# Altium schematic sheet 09_AUDIO.SchDoc
size 287 x 157 mm; DsnPath: C:\Users\nilot\Documents\VSCode\SBC\imports\SG2002_QFN88_38_20230301_4L_V1.3_16.2.DSN; SchematicName: CV181xC_QFN88_38_DemoBoard; PageName: 09_AUDIO; PageSize: Custom; TopSchematic: True
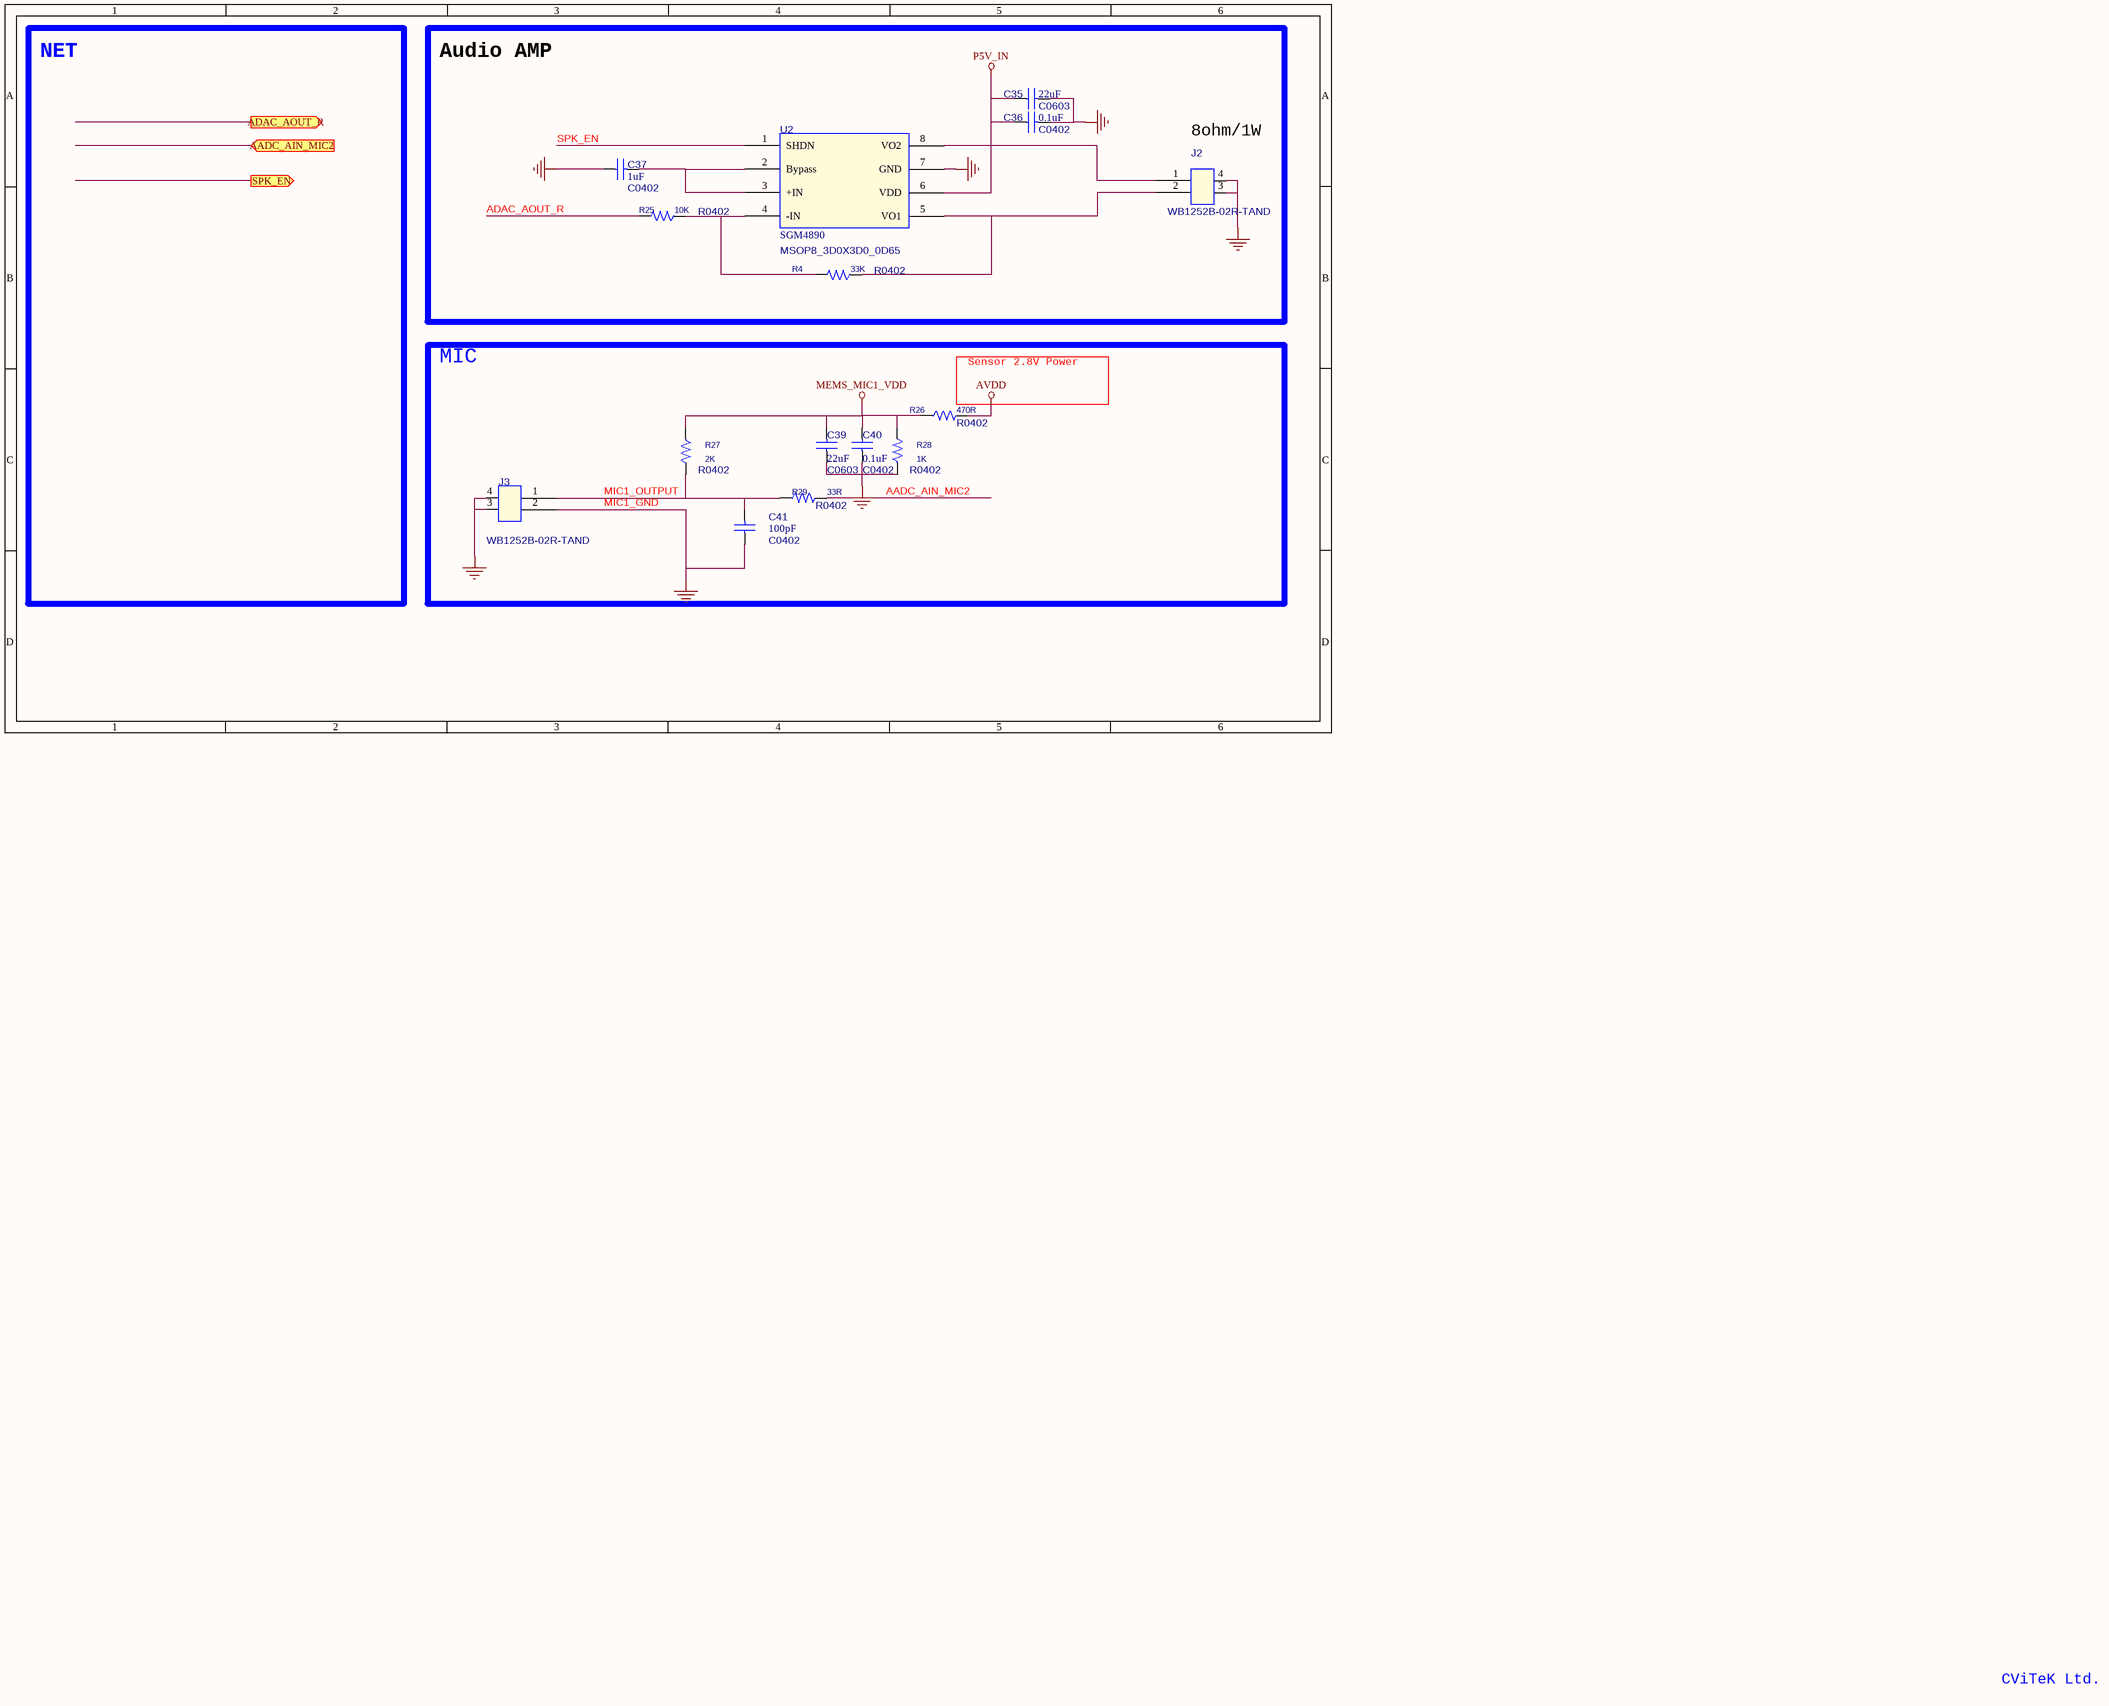
[diagram p0: 09_AUDIO.SchDoc]

## Parts
C35  22uF  [C0603]
C36  0.1uF  [C0402]
C37  1uF  [C0402]
C39  22uF  [C0603]
C40  0.1uF  [C0402]
C41  100pF  [C0402]
J2  WB1252B-02R-TAND  [WF2_4D4X7D25_1D25_SMD_L]
J3  WB1252B-02R-TAND  [WF2_4D4X7D25_1D25_SMD_L]
R4  33K  [R0402]
R25  10K  [R0402]
R26  470R  [R0402]
R27  2K  [R0402]
R28  1K  [R0402]
R29  33R  [R0402]
U2  SGM4890  [MSOP8_3D0X3D0_0D65]

## Blocks framed on the sheet
Audio AMP: C35-C37 J2 R4 R25 U2
MIC: C39-C41 J3 R26-R29

## Ports
AADC_AIN_MIC2 (in), ADAC_AOUT_R (out), SPK_EN (out)

## Nets
AVDD: R26.2
MEMS_MIC1_VDD: C39.2 C40.2 R26.1 R27.1 R28.2
MIC1_GND: C35.2 C36.2 C37.1 C39.1 C40.1 C41.1 J2.3(GND1) J2.4(GND2) J3.2 J3.3(GND1) J3.4(GND2) R28.1 U2.7(GND)  [also labelled GND]
P5V_IN: C35.1 C36.1 U2.6(VDD)
AADC_AIN_MIC2: R29.2
ADAC_AOUT_R: R25.2
MIC1_OUTPUT: C41.2 J3.1 R27.2 R29.1
SPK_EN: U2.1(SHDN)
NetC37_2: C37.2 U2.2(Bypass) U2.3(+IN)
NetJ2_1: J2.1 U2.8(VO2)
NetJ2_2: J2.2 R4.1 U2.5(VO1)
NetR4_2: R4.2 R25.1 U2.4(-IN)

## Notes on the sheet
- NET
- (near J2) 8ohm/1W
- Sensor 2.8V Power
- CViTeK Ltd.

## Library data of the parts
C35 = C: C0402; Part Name: sC0402; Part Number: GRM155R61E104KA87D; Part Reference: C35; Cloud IC Number: Y02110431K00; Vendor: murata; Value: 22uF; PCB Footprint: C0603
C36 = C: C0402; Part Name: sC0402; Part Number: GRM155R61E104KA87D; Part Reference: C36; Cloud IC Number: Y02110431K00; Vendor: murata; Value: 0.1uF; PCB Footprint: C0402
C37 = C: C0402; Part Name: sC0402; Part Number: GRM155R61E104KA87D; Part Reference: C37; Cloud IC Number: Y02110431K00; Vendor: murata; Value: 1uF; PCB Footprint: C0402
C39 = C: C0603; Part Number: GRM155R61E104KA87D; Part Reference: C39; Cloud IC Number: Y02110431K00; Vendor: murata; Part Name: C0603; Value: 22uF; PCB Footprint: C0603
C40 = C: C0603; Part Number: GRM155R61E104KA87D; Part Reference: C40; Cloud IC Number: Y02110431K00; Vendor: murata; Part Name: C0603; Value: 0.1uF; PCB Footprint: C0402
C41 = C: C0603; Part Number: GRM155R61E104KA87D; Part Reference: C41; Cloud IC Number: Y02110431K00; Vendor: murata; Part Name: C0603; Value: 100pF; PCB Footprint: C0402
J2 = CON6_5: Part Reference: J2; Value: WB1252B-02R-TAND; PCB Footprint: WF2_4D4X7D25_1D25_SMD_L
J3 = CON6_5: Part Reference: J3; Value: WB1252B-02R-TAND; PCB Footprint: WF2_4D4X7D25_1D25_SMD_L
R4 = R_Dup2: Part Reference: R4; Value: 33K; PCB Footprint: R0402
R25 = R_Dup2: Part Reference: R25; Value: 10K; PCB Footprint: R0402
R26 = R_Dup2: Part Reference: R26; Value: 470R; PCB Footprint: R0402
R27 = R_Dup1: R0402; Part Reference: R27; Manufacturer Part number: Y01102201F00; Value: 2K; PCB Footprint: R0402; Part Number: Y01102201F00; Part Name: R0402
R28 = R_Dup2: Part Reference: R28; Value: 1K; PCB Footprint: R0402
R29 = R_Dup1: R0402; Part Reference: R29; Manufacturer Part number: Y01102201F00; Value: 33R; PCB Footprint: R0402; Part Number: Y01102201F00; Part Name: R0402
U2 = SGM4890YMS: Part Reference: U2; Value: SGM4890; PCB Footprint: MSOP8_3D0X3D0_0D65